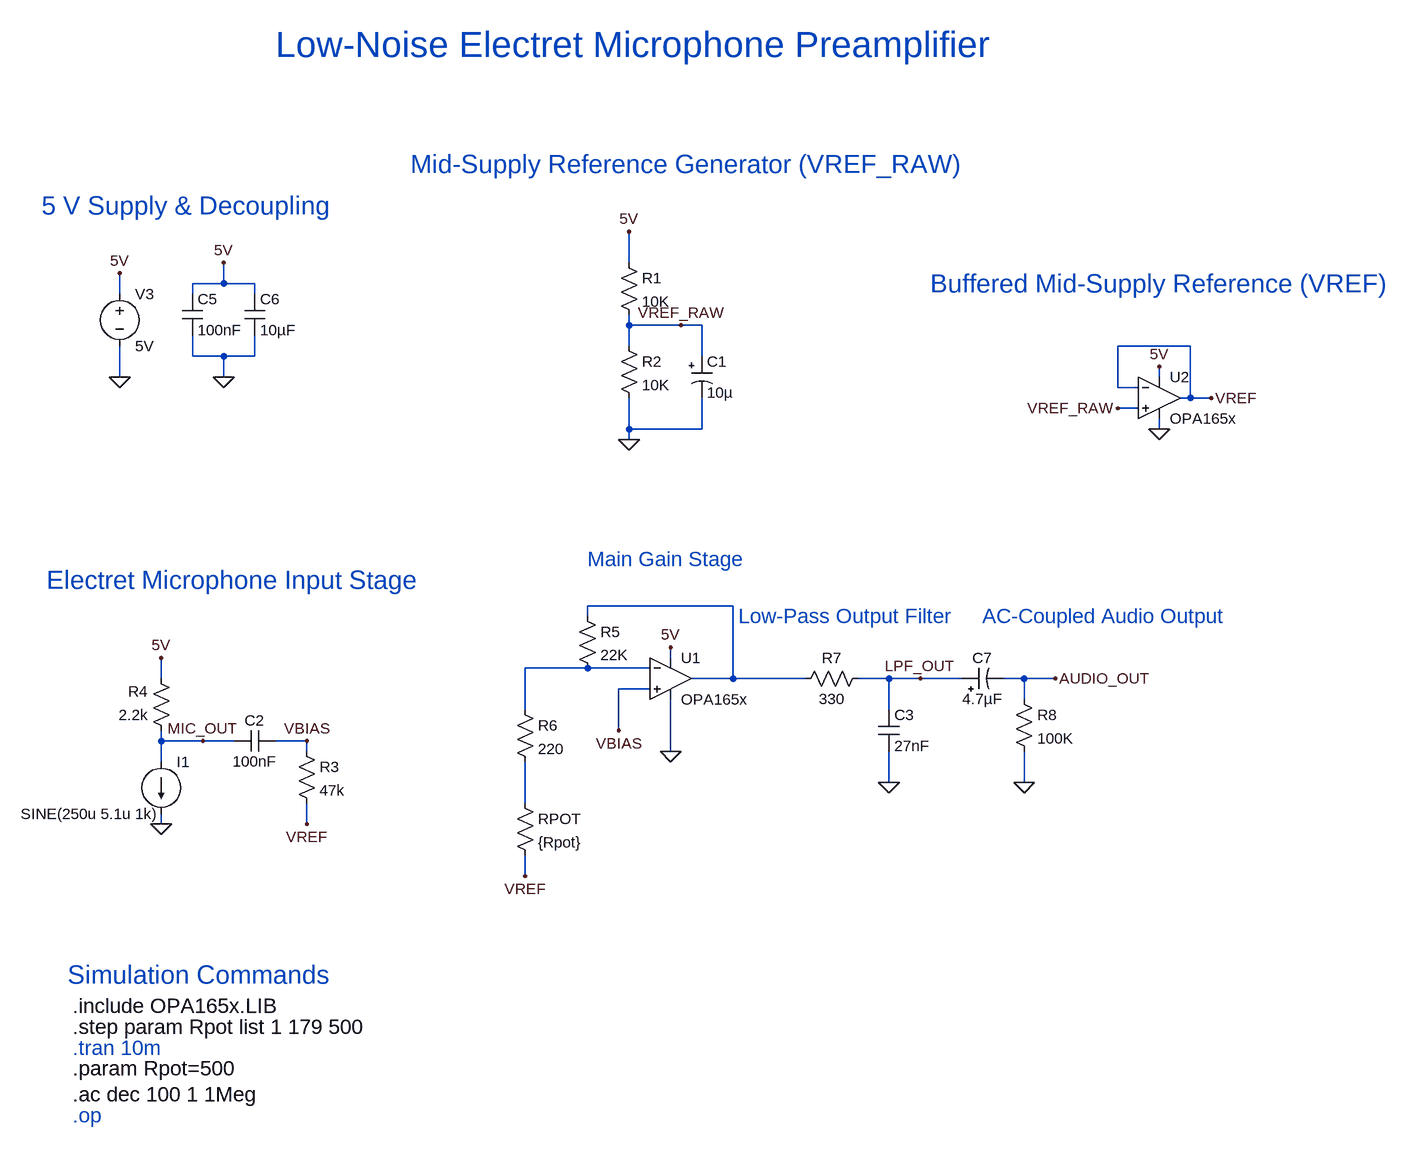
[diagram p0: schematic Microphone_Preamplifier_OPA165x.asc]
Microphone_Preamplifier_OPA165x.asc, the LTspice schematic file:
Version 4
SHEET 1 2616 1068
WIRE 688 -576 688 -624
WIRE 64 -544 64 -576
WIRE 64 -544 16 -544
WIRE 112 -544 64 -544
WIRE -96 -528 -96 -560
WIRE 16 -528 16 -544
WIRE 112 -528 112 -544
WIRE 688 -480 688 -496
WIRE 768 -480 688 -480
WIRE 800 -480 768 -480
WIRE 688 -448 688 -480
WIRE 1552 -448 1440 -448
WIRE 16 -432 16 -464
WIRE 64 -432 16 -432
WIRE 112 -432 112 -464
WIRE 112 -432 64 -432
WIRE 800 -432 800 -480
WIRE -96 -400 -96 -448
WIRE 64 -400 64 -432
WIRE 1504 -400 1504 -416
WIRE 1440 -384 1440 -448
WIRE 1472 -384 1440 -384
WIRE 1552 -368 1552 -448
WIRE 1552 -368 1536 -368
WIRE 1584 -368 1552 -368
WIRE 1472 -352 1440 -352
WIRE 688 -320 688 -368
WIRE 800 -320 800 -368
WIRE 800 -320 688 -320
WIRE 1504 -320 1504 -336
WIRE 688 -304 688 -320
WIRE 848 -48 624 -48
WIRE 624 -32 624 -48
WIRE 752 32 752 16
WIRE 624 48 528 48
WIRE 720 48 624 48
WIRE -32 64 -32 32
WIRE 848 64 848 -48
WIRE 848 64 784 64
WIRE 960 64 848 64
WIRE 1088 64 1040 64
WIRE 1136 64 1088 64
WIRE 1200 64 1136 64
WIRE 1296 64 1264 64
WIRE 1344 64 1296 64
WIRE 720 80 672 80
WIRE 1296 96 1296 64
WIRE 528 112 528 48
WIRE 1088 112 1088 64
WIRE 672 144 672 80
WIRE -32 160 -32 144
WIRE 32 160 -32 160
WIRE 80 160 32 160
WIRE 192 160 144 160
WIRE 192 176 192 160
WIRE 752 176 752 96
WIRE -32 192 -32 160
WIRE 1088 224 1088 176
WIRE 1296 224 1296 176
WIRE 528 256 528 192
WIRE -32 288 -32 272
WIRE 192 288 192 256
WIRE 528 368 528 336
FLAG 688 -304 0
FLAG 768 -480 VREF_RAW
FLAG 752 176 0
FLAG 672 144 VBIAS
FLAG 528 368 VREF
FLAG 1088 224 0
FLAG 1504 -320 0
FLAG 1440 -352 VREF_RAW
FLAG 192 288 VREF
FLAG 1584 -368 VREF
FLAG 1136 64 LPF_OUT
FLAG 1504 -416 5V
FLAG 752 16 5V
FLAG 64 -576 5V
FLAG 64 -400 0
FLAG -96 -400 0
FLAG -96 -560 5V
FLAG -32 32 5V
FLAG -32 288 0
FLAG 32 160 MIC_OUT
FLAG 192 160 VBIAS
FLAG 1296 224 0
FLAG 1344 64 AUDIO_OUT
FLAG 688 -624 5V
SYMBOL res 672 -592 R0
SYMATTR InstName R1
SYMATTR Value 10K
SYMBOL res 672 -464 R0
SYMATTR InstName R2
SYMATTR Value 10K
SYMBOL polcap 784 -432 R0
WINDOW 3 24 56 Left 2
SYMATTR Value 10µ
SYMATTR InstName C1
SYMATTR Description Capacitor
SYMATTR Type cap
SYMATTR SpiceLine Rser=4 Lser=0 mfg="AVX" pn="TAJA106M006" type="Tantalum"
SYMBOL Res 176 160 R0
SYMATTR InstName R3
SYMATTR Value 47k
SYMBOL Res -16 160 R180
WINDOW 0 36 76 Left 2
WINDOW 3 36 40 Left 2
SYMATTR InstName R4
SYMATTR Value 2.2k
SYMBOL OpAmps/opamp2 752 0 R0
SYMATTR InstName U1
SYMATTR Value OPA165x
SYMBOL Res 608 -48 R0
SYMATTR InstName R5
SYMATTR Value 22K
SYMBOL Res 512 96 R0
SYMATTR InstName R6
SYMATTR Value 220
SYMBOL Res 512 240 R0
SYMATTR InstName RPOT
SYMATTR Value {Rpot}
SYMBOL Res 1056 48 R90
WINDOW 0 0 56 VBottom 2
WINDOW 3 32 56 VTop 2
SYMATTR InstName R7
SYMATTR Value 330
SYMBOL Cap 1072 112 R0
SYMATTR InstName C3
SYMATTR Value 27nF
SYMBOL OpAmps/opamp2 1504 -432 R0
SYMATTR InstName U2
SYMATTR Value OPA165x
SYMBOL Res 1280 80 R0
SYMATTR InstName R8
SYMATTR Value 100K
SYMBOL Cap 0 -528 R0
SYMATTR InstName C5
SYMATTR Value 100nF
SYMBOL Cap 96 -528 R0
SYMATTR InstName C6
SYMATTR Value 10µF
SYMBOL Voltage -96 -544 R0
SYMATTR InstName V3
SYMATTR Value 5V
SYMBOL Cap 144 144 R90
WINDOW 0 0 32 VBottom 2
WINDOW 3 32 32 VTop 2
SYMATTR InstName C2
SYMATTR Value 100nF
SYMBOL current -32 192 R0
WINDOW 3 -4 80 Right 2
SYMATTR Value SINE(250u 5.1u 1k)
SYMATTR InstName I1
SYMATTR Value2 AC 1
SYMBOL polcap 1200 80 R270
WINDOW 0 32 32 VTop 2
WINDOW 3 0 32 VBottom 2
SYMATTR InstName C7
SYMATTR Value 4.7µF
TEXT -168 568 Left 3 !.include OPA165x.LIB
TEXT -168 600 Left 3 !.step param Rpot list 1 179 500
TEXT -168 704 Left 3 !.ac dec 100 1 1Meg
TEXT -168 632 Left 3 ;.tran 10m
TEXT -168 664 Left 3 !.param Rpot=500
TEXT 144 -912 Left 5 ;Low-Noise Electret Microphone Preamplifier
TEXT -216 -664 Left 4 ;5 V Supply & Decoupling
TEXT 352 -728 Left 4 ;Mid-Supply Reference Generator (VREF_RAW)
TEXT 1152 -544 Left 4 ;Buffered Mid-Supply Reference (VREF)
TEXT -208 -88 Left 4 ;Electret Microphone Input Stage
TEXT 624 -120 Left 3 ;Main Gain Stage
TEXT 856 -32 Left 3 ;Low-Pass Output Filter
TEXT 1232 -32 Left 3 ;AC-Coupled Audio Output
TEXT -176 520 Left 4 ;Simulation Commands
TEXT -168 736 Left 3 ;.op

The netlist it stands for:
* Microphone_Preamplifier_OPA165x.asc
R1 5V VREF_RAW 10K
R2 VREF_RAW 0 10K
C1 VREF_RAW 0 10µ Rser=4 Lser=0 mfg="AVX" pn="TAJA106M006" type="Tantalum"
R3 VBIAS VREF 47k
R4 MIC_OUT 5V 2.2k
XU1 VBIAS N002 5V 0 N001 OPA165x  ; pins In+ In- V+ V- OUT
R5 N001 N002 22K
R6 N002 N003 220
RPOT N003 VREF {Rpot}
R7 LPF_OUT N001 330
C3 LPF_OUT 0 27nF
XU2 VREF_RAW VREF 5V 0 VREF OPA165x  ; pins In+ In- V+ V- OUT
R8 AUDIO_OUT 0 100K
C5 5V 0 100nF
C6 5V 0 10µF
V3 5V 0 5V
C2 VBIAS MIC_OUT 100nF
I1 MIC_OUT 0 SINE(250u 5.1u 1k) AC 1
C7 LPF_OUT AUDIO_OUT 4.7µF
.include OPA165x.LIB
.step param Rpot list 1 179 500
.ac dec 100 1 1Meg
* .tran 10m
.param Rpot=500
* Low-Noise Electret Microphone Preamplifier
* 5 V Supply & Decoupling
* Mid-Supply Reference Generator (VREF_RAW)
* Buffered Mid-Supply Reference (VREF)
* Electret Microphone Input Stage
* Main Gain Stage
* Low-Pass Output Filter
* AC-Coupled Audio Output
* Simulation Commands
* .op
.backanno
.end